# Altium schematic sheet POWER_SUPPLY.SchDoc
size A4; SheetNumber: 5; SheetTotal: 9
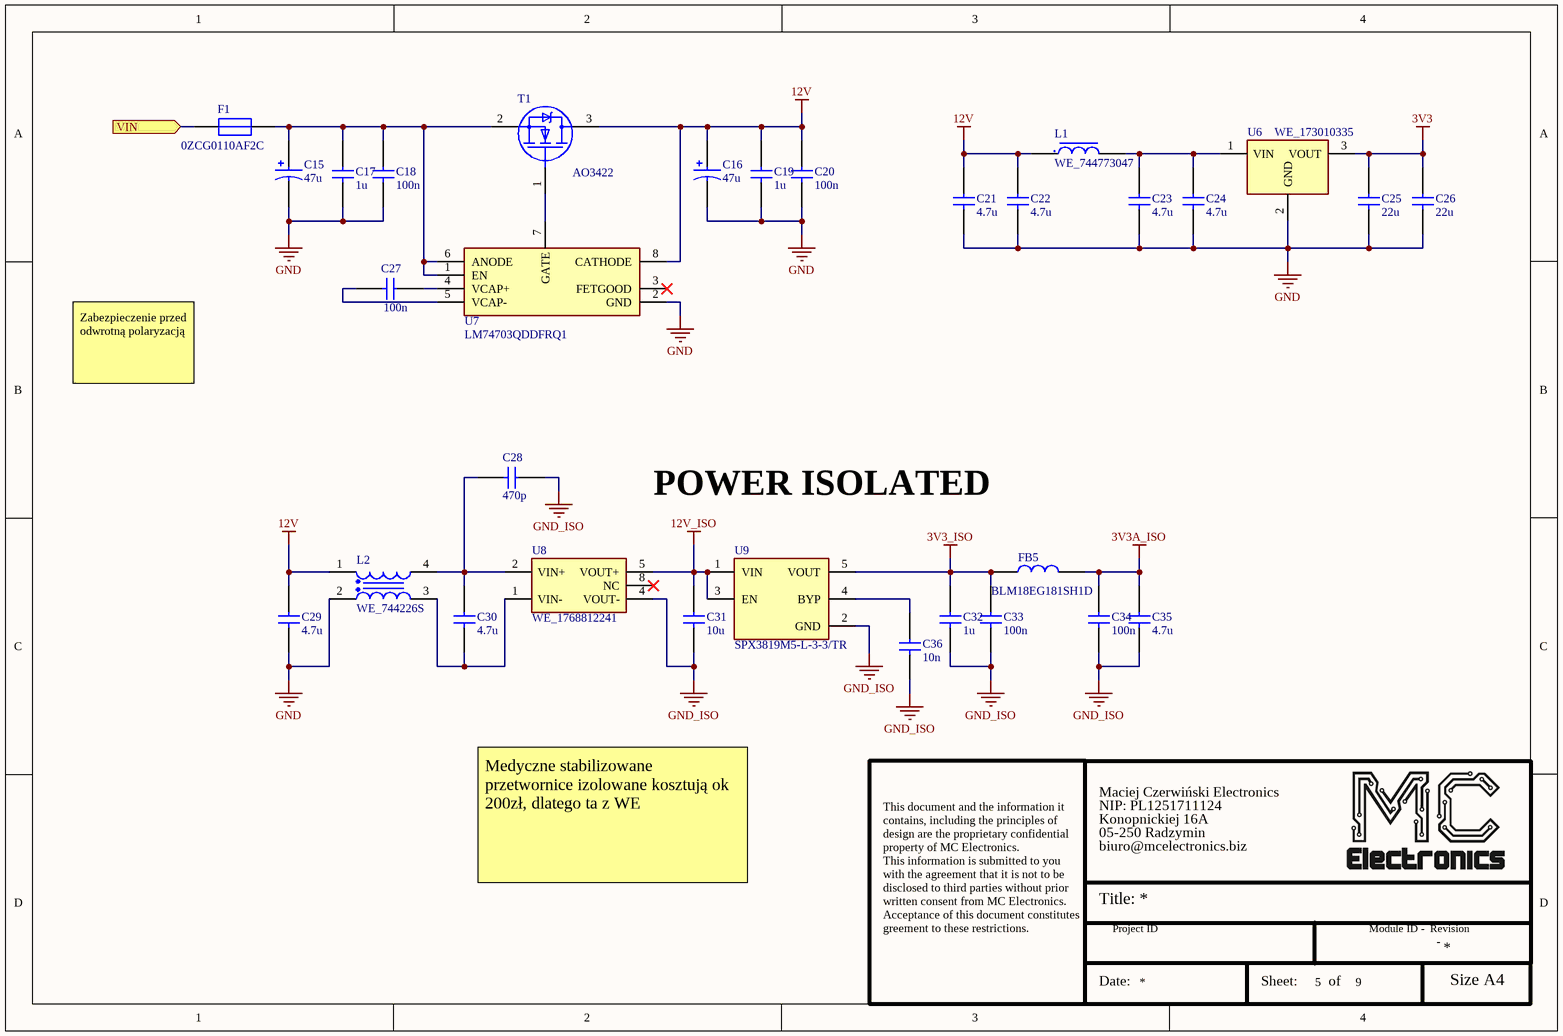
[diagram p0: POWER_SUPPLY.SchDoc]

## Parts
C15  value 47u  [CAPAE7866X65N]  (hidden comment: 47u 50V fi6.3x5.5mm)
C16  value 47u  [CAPAE7866X65N]  (hidden comment: 47u 50V fi6.3x5.5mm)
C17  value 1u  [0603C]  (hidden comment: 1uF 50V X5R 10%)
C18  value 100n  [0603C]  (hidden comment: 100nF 50V X7R 10%)
C19  value 1u  [0603C]  (hidden comment: 1uF 50V X5R 10%)
C20  value 100n  [0603C]  (hidden comment: 100nF 50V X7R 10%)
C21  value 4.7u  [1210C]  (hidden comment: 4.7uF 50V X5R 10%)
C22  value 4.7u  [1210C]  (hidden comment: 4.7uF 50V X5R 10%)
C23  value 4.7u  [1210C]  (hidden comment: 4.7uF 50V X5R 10%)
C24  value 4.7u  [1210C]  (hidden comment: 4.7uF 50V X5R 10%)
C25  value 22u  [1210C]  (hidden comment: 22uF 25V X5R 10%)
C26  value 22u  [1210C]  (hidden comment: 22uF 25V X5R 10%)
C27  value 100n  [0603C]  (hidden comment: 100nF 50V X7R 10%)
C28  value 470p  [1808C]  (hidden comment: 470pF 3kV X7R 10%)
C29  value 4.7u  [1210C]  (hidden comment: 4.7uF 16V X7R 10%)
C30  value 4.7u  [1210C]  (hidden comment: 4.7uF 16V X7R 10%)
C31  value 10u  [1210C]  (hidden comment: 10uF 16V X7R 10%)
C32  value 1u  [0603C]  (hidden comment: 1uF 16V X5R 10%)
C33  value 100n  [0603C]  (hidden comment: 100nF 50V X7R 10%)
C34  value 100n  [0603C]  (hidden comment: 100nF 50V X7R 10%)
C35  value 4.7u  [0603C]  (hidden comment: 4.7uF 16V X5R 10%)
C36  value 10n  [0603C]  (hidden comment: 10nF 50V X7R 10%)
F1  0ZCG0110AF2C  [Fuse_1812]
FB5  BLM18EG181SH1D  [0603FB]
L1  WE_744773047  [Inductor SMD 4.5x4mm]
L2  WE_744226S  [WE-SL2_L9.2W6H5]
T1  AO3422  [SOT95P235X110-3N]
U6  WE_173010335  [173010335]
U7  LM74703QDDFRQ1  [SOT23127P600-8N]
U8  WE_1768812241  [WE_1768812241]
U9  SPX3819M5-L-3-3/TR  [SOT95P280X110-5N]

## Ports
VIN (in)

## Nets
3V3: C25.2 C26.2 U6.3(VOUT)
3V3_ISO: C32.2 C33.2 FB5.1 U9.5(VOUT)
3V3A_ISO: C34.2 C35.2 FB5.2
12V: C16.1 C19.2 C20.2 C21.2 C22.2 C29.2 L1.1 L2.1 T1.3(C) U7.8(CATHODE)
12V_ISO: C31.2 U8.5(VOUT+) U9.1(VIN) U9.3(EN)
GND: C15.2 C16.2 C17.1 C18.1 C19.1 C20.1 C21.1 C22.1 C23.1 C24.1 C25.1 C26.1 C29.1 L2.2 U6.2(GND) U7.2(GND)
GND_ISO: C28.2 C31.1 C32.1 C33.1 C34.1 C35.1 C36.1 U8.4(VOUT-) U9.2(GND)
VIN: F1.2 ; port VIN
NetC15_1: C15.1 C17.2 C18.2 F1.1 T1.2(E) U7.1(EN) U7.6(ANODE)
NetC23_2: C23.2 C24.2 L1.2 U6.1(VIN)
NetC27_1: C27.1 U7.5(VCAP-)
NetC27_2: C27.2 U7.4(VCAP+)
NetC28_1: C28.1 C30.2 L2.4 U8.2(VIN+)
NetC30_1: C30.1 L2.3 U8.1(VIN-)
NetC36_2: C36.2 U9.4(BYP)
NetT1_1: T1.1(B) U7.7(GATE)

Not connected (* = marked no-connect by the designer): U7 3(FETGOOD)*; U8 8(NC)*

## Notes on the sheet
- Zabezpieczenie przed odwrotną polaryzacją
- POWER ISOLATED
- Medyczne stabilizowane przetwornice izolowane kosztują ok 200zł, dlatego ta z WE
- This document and the information it
- contains, including the principles of
- design are the proprietary confidential
- property of MC Electronics.
- Maciej Czerwiński Electronics
- NIP: PL1251711124
- Konopnickiej 16A
- 05-250 Radzymin
- biuro@mcelectronics.biz
- This information is submitted to you
- with the agreement that it is not to be
- disclosed to third parties without prior
- written consent from MC Electronics.
- Acceptance of this document constitutes
- Title:
- greement to these restrictions.
- Date:
- Project ID
- Sheet:
- of
- Module ID -
- Revision
- -
- Size A4

## Library data of the parts
C15 C16 = GEN_47uF_50V_20%_SMD: Electrolitic capacitor 47u/50V 6.3x5.8mm; Generic: Yes; MC_ID: CPO00007; Mount type: SMT
C17 C19 = GEN_1uF_50V_X5R_10%_0603: Generic capacitor 1u 0603; MC_ID: C00037; Generic: Yes; Mount type: SMT
C18 C20 C27 C33 C34 = GEN_100nF_50V_X7R_10%_0603: Generic capacitor 100n 0603; MC_ID: C00001; Generic: Yes; Mount type: SMT
C21-C24 = GEN_4.7uF_50V_X5R_10%_1210: Generic capacitor 4.7uF 50V 1210; MC_ID: C00059; Generic: Yes; Mount type: SMT
C25 C26 = GEN_22uF_25V_X5R_10%_1210: Generic capacitor 22uF 25V 1210; Generic: Yes; MC_ID: C00013; Mount type: SMT
C28 = SPEC_470pF_3kV_X7R_10%_1808: Capacitor 470pF 3kV X7R 1808; MC_ID: x; Generic: Yes; Specific PN: WE_885342210003; Mount type: SMT
C29 C30 = SPEC_4.7uF_16V_X7R_10%_1210: Capacitor 4.7uF 16V X7R 1210; MC_ID: x; Generic: Yes; Specific PN: WE_885012209013; Mount type: SMT
C31 = SPEC_10uF_16V_X7R_10%_1210: Capacitor 10uF 16V X7R 1210; MC_ID: x; Generic: Yes; Specific PN: WE_885012209014; Mount type: SMT
C32 = GEN_1uF_16V_X5R_10%_0603: Generic capacitor 1u 0603; Generic: Yes; MC_ID: C00017; Mount type: SMT
C35 = GEN_4.7uF_16V_X5R_10%_0603: Generic capacitor 4.7u 0603; MC_ID: C00066; Generic: Yes; Mount type: SMT
C36 = GEN_10nF_50V_X7R_10%_0603: Generic capacitor 10n 0603; Generic: Yes; MC_ID: C00038; Mount type: SMT
F1 = 0ZCG0110AF2C: 1.1A 16V  fuse, 1812; MC_ID: B00005; Generic: No; Specific PN: 0ZCG0110AF2C; Mount type: SMT
FB5 = BLM18EG181SH1D: Ferrite bead 0603 1A 50mOhm, 1MHz - 180Ohm; Generic: No; MC_ID: FB00019; Specific PN: BLM18EG181SH1D; Mount type: SMT
L1 = IND_4.7uH_1.85A_0.11R_4545: Inductor 4.7uH 1.82A; MC_ID: L00018; Generic: No; Specific PN: WE_744773047; Value: 4.7uH; Mount type: SMT
L2 = WE_744226S: Common mode choke 10uH 1.6A; Generic: No; MC_ID: x; Mount type: SMT; Specific PN: WE_744226S; Value: 10uH
T1 = AO3422: N-MOSFET;AO3422; 55V; 1,7A; 800mW; SOT23; Generic: No; MC_ID: TPO00046; Specific PN: AO3422; Mount type: SMT
U6 = WE_173010335: Fixed step down converter 3.3V/1A output; MC_ID: IC00022; Generic: No; Specific PN: WE_173010335; Mount type: THT
U7 = LM74703QDDFRQ1: Ideal diode controller; Generic: No; MC_ID: IC00776; Mount type: SMT; Specific PN: LM74703QDDFRQ1
U8 = WE_1768812241: Isolated converter 10.8-13.2/12V 1W; Generic: No; MC_ID: x; Specific PN: WE_1768812241; Mount type: SMT
U9 = SPX3819M5-L-3-3/TR: Linear regulator 3.3V 0.5A; Generic: No; MC_ID: IC00068; Mount type: SMT; Specific PN: SPX3819M5-L-3-3/TR